# Altium schematic sheet bspd.SchDoc
size 594 x 420 mm
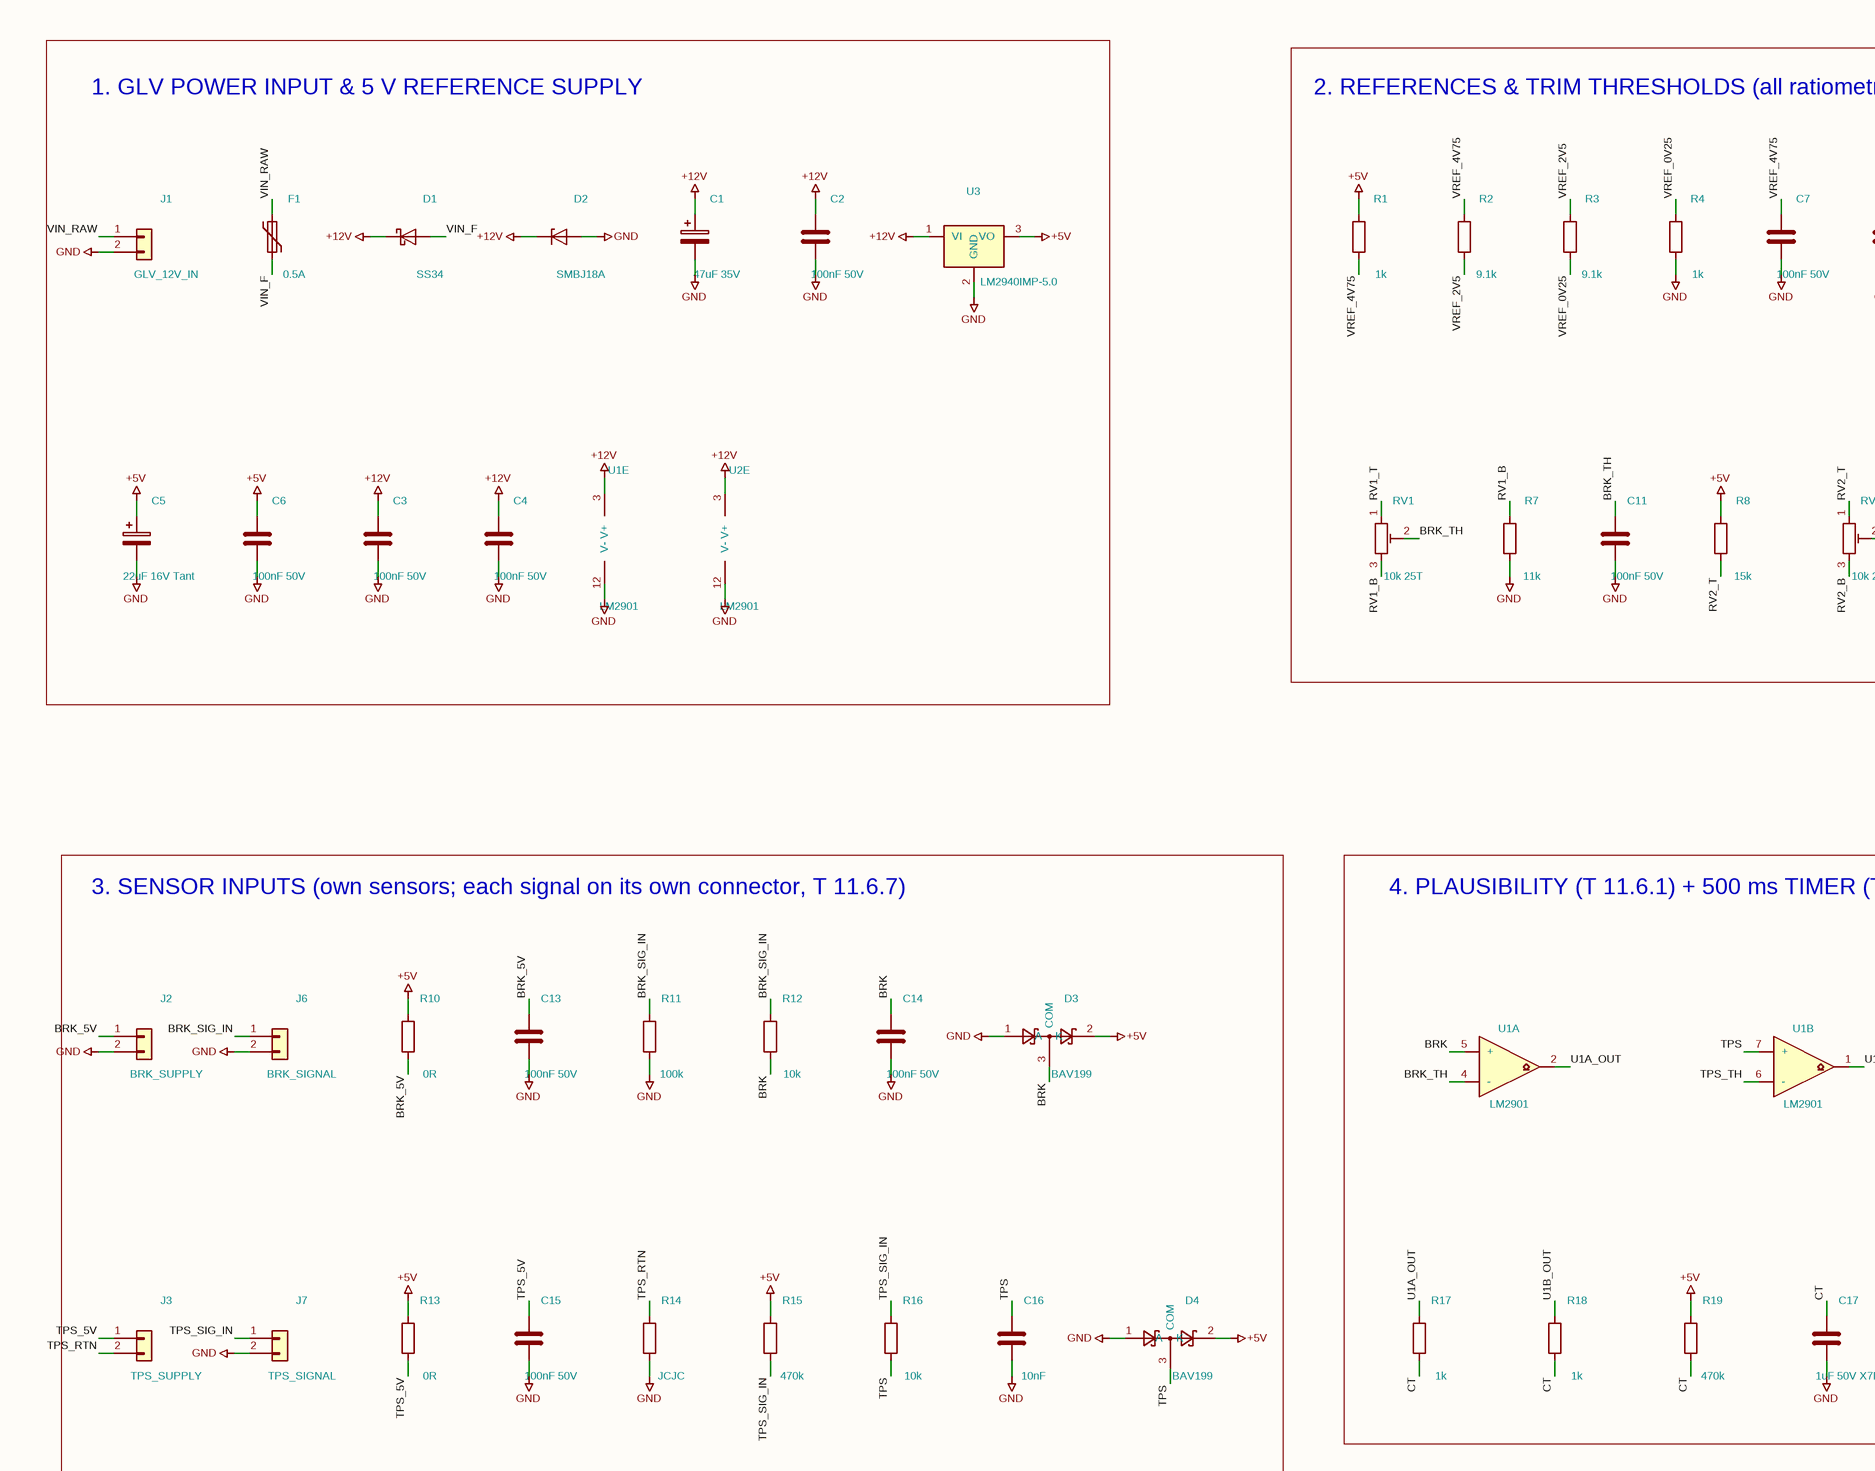
[diagram p0: bspd.SchDoc, top left]
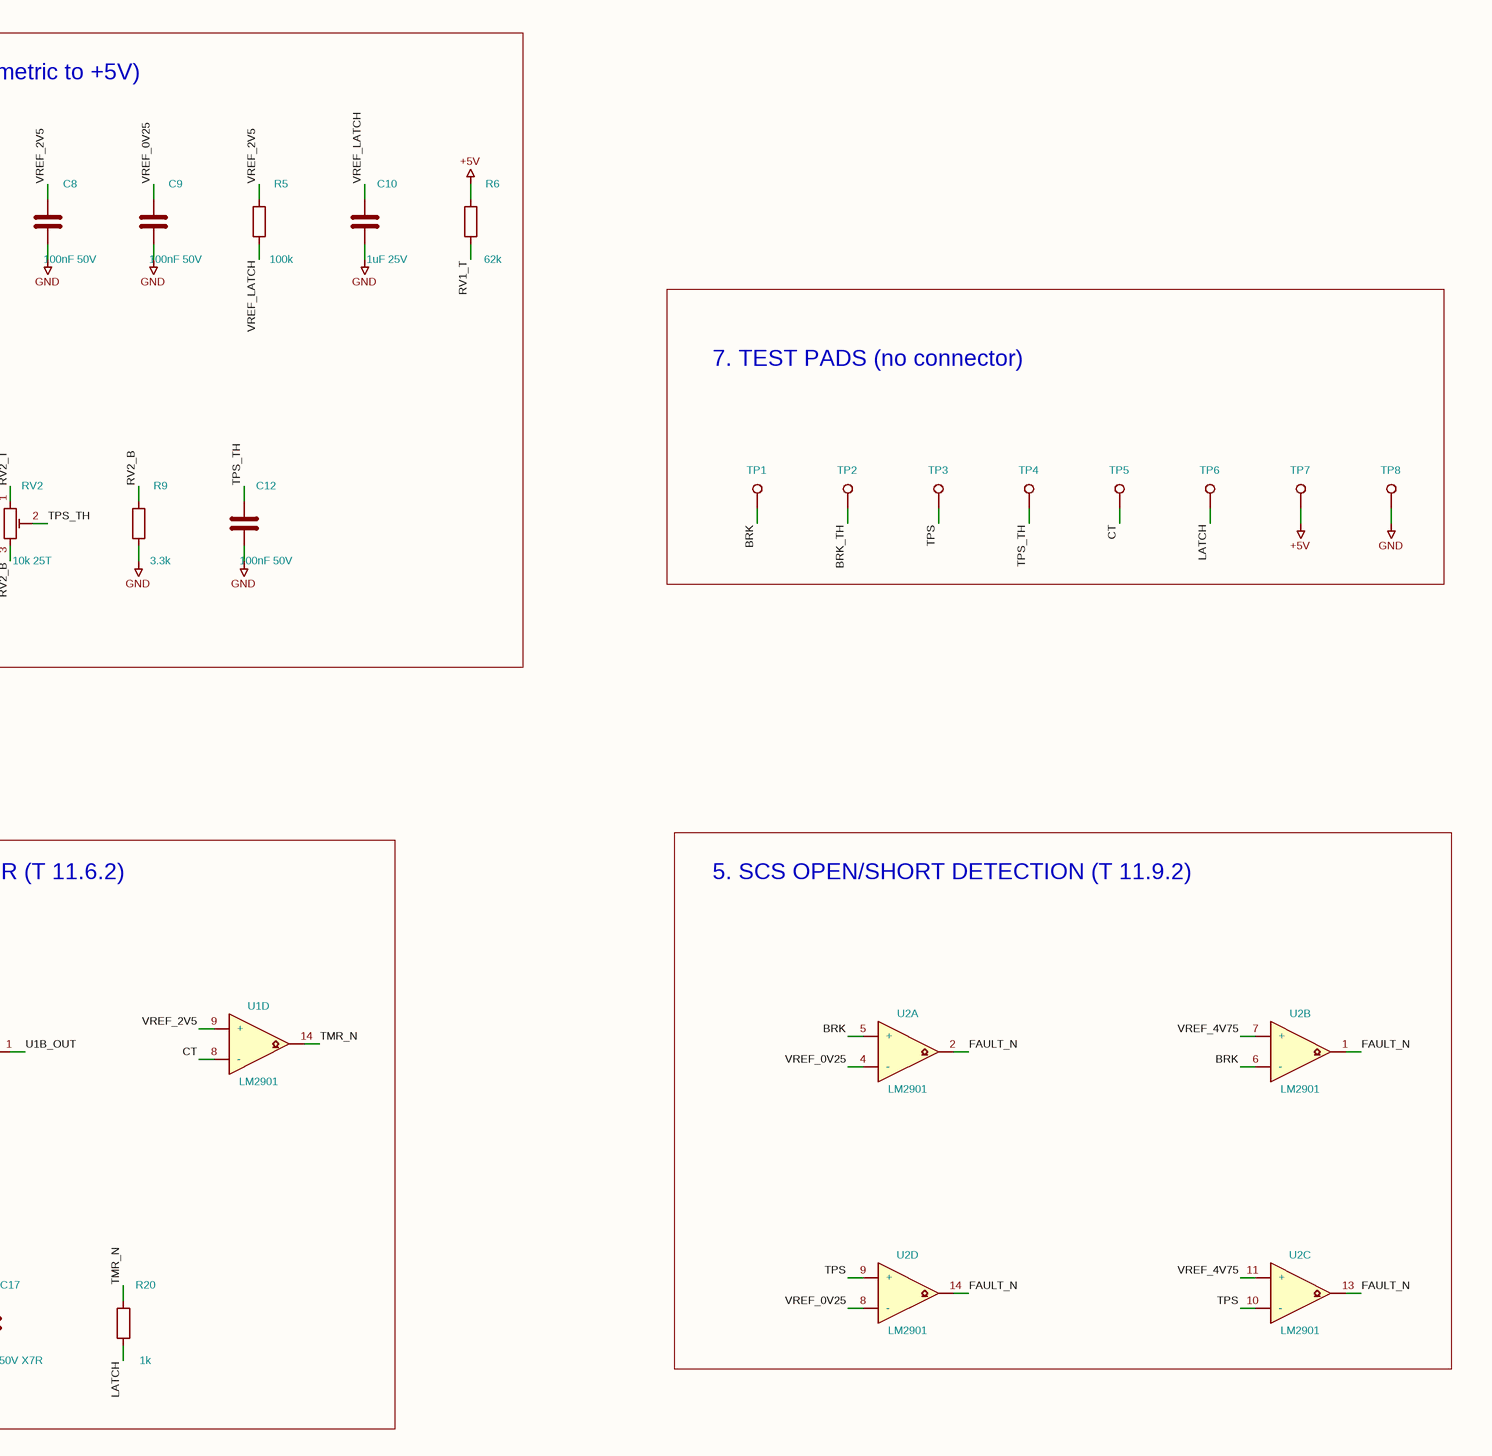
[diagram p1: bspd.SchDoc, top right]
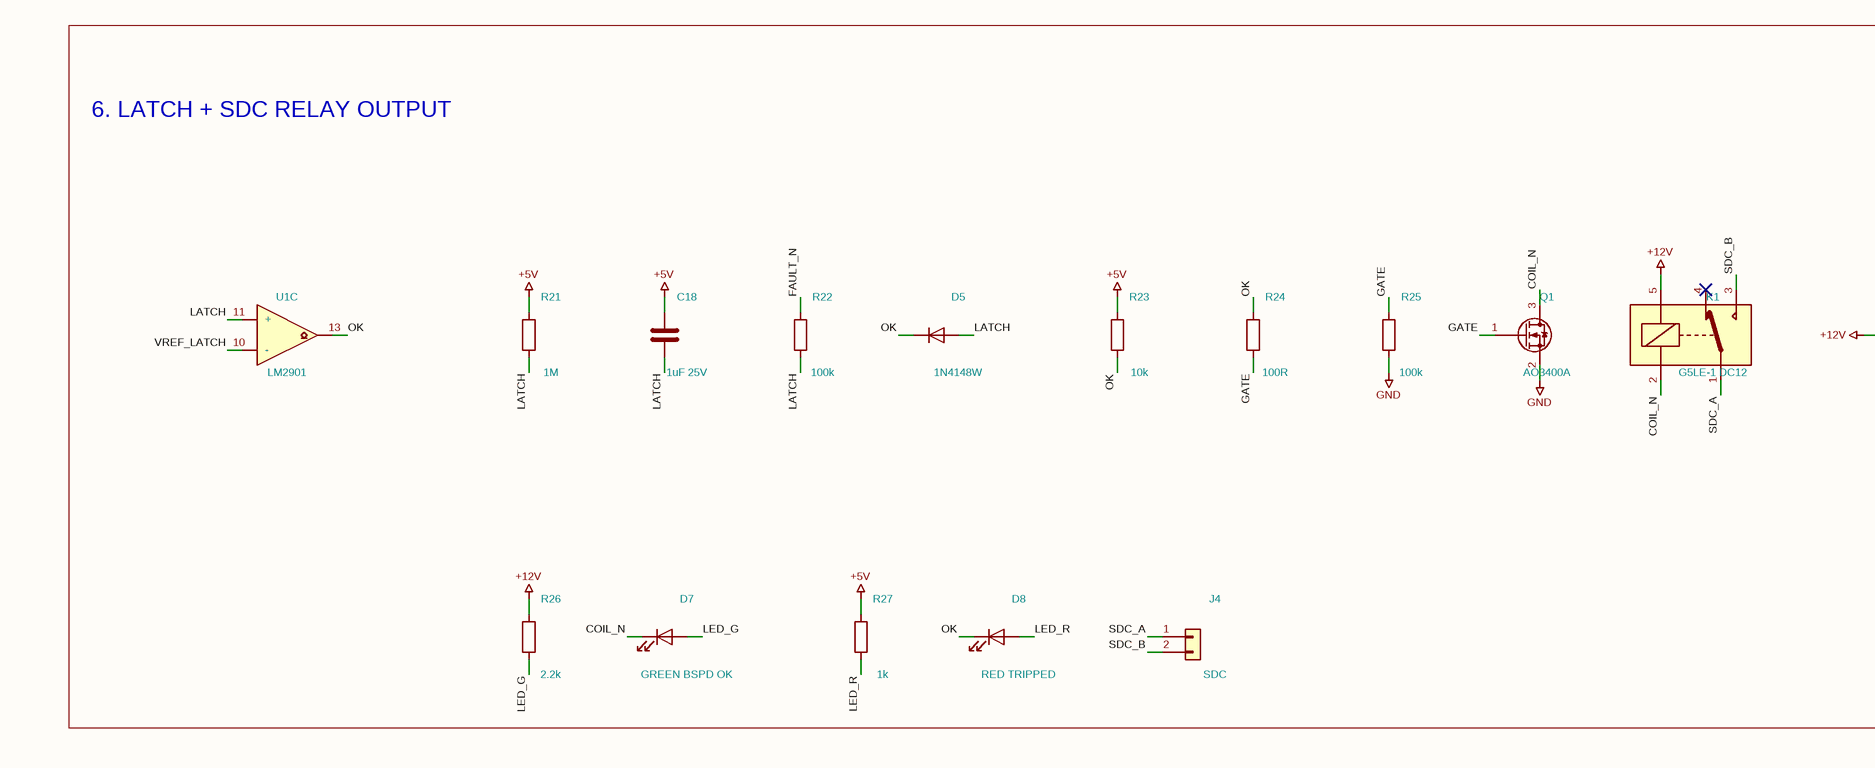
[diagram p2: bspd.SchDoc, bottom left]
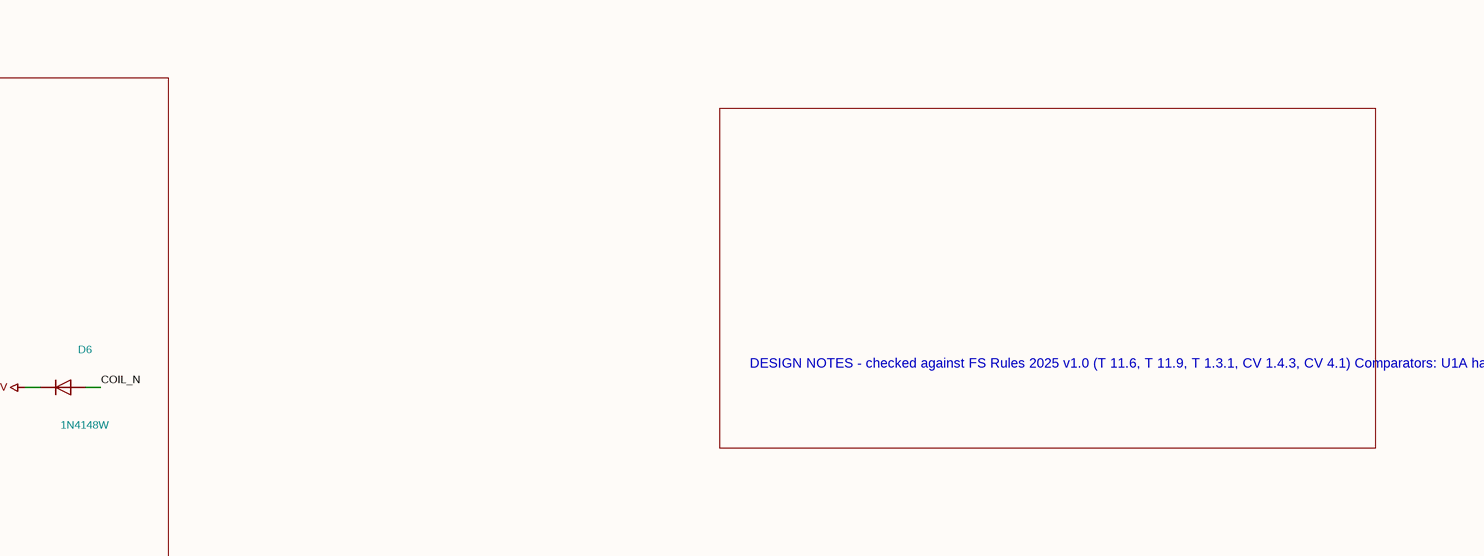
[diagram p3: bspd.SchDoc, bottom right]

## Parts
C1  47uF 35V  [CP_Elec_6.3x7.7]
C2  100nF 50V  [C_0603_1608Metric]
C3  100nF 50V  [C_0603_1608Metric]
C4  100nF 50V  [C_0603_1608Metric]
C5  22uF 16V Tant  [CP_EIA-3528-21_Kemet-B]
C6  100nF 50V  [C_0603_1608Metric]
C7  100nF 50V  [C_0603_1608Metric]
C8  100nF 50V  [C_0603_1608Metric]
C9  100nF 50V  [C_0603_1608Metric]
C10  1uF 25V  [C_0805_2012Metric]
C11  100nF 50V  [C_0603_1608Metric]
C12  100nF 50V  [C_0603_1608Metric]
C13  100nF 50V  [C_0603_1608Metric]
C14  100nF 50V  [C_0603_1608Metric]
C15  100nF 50V  [C_0603_1608Metric]
C16  10nF  [C_0603_1608Metric]
C17  1uF 50V X7R  [C_1206_3216Metric]
C18  1uF 25V  [C_0805_2012Metric]
D1  SS34  [D_SMA]
D2  SMBJ18A  [D_SMB]
D3  BAV199  [SOT-23]
D4  BAV199  [SOT-23]
D5  1N4148W  [D_SOD-123]
D6  1N4148W  [D_SOD-123]
D7  GREEN BSPD OK  [LED_0805_2012Metric]
D8  RED TRIPPED  [LED_0805_2012Metric]
F1  0.5A  [Fuse_1812_4532Metric]
J1  GLV_12V_IN  [Molex_Micro-Fit_3.0_43650-0215_1x02_P3.00mm_Vertical]
J2  BRK_SUPPLY  [Molex_Micro-Fit_3.0_43650-0215_1x02_P3.00mm_Vertical]
J3  TPS_SUPPLY  [Molex_Micro-Fit_3.0_43650-0215_1x02_P3.00mm_Vertical]
J4  SDC  [Molex_Micro-Fit_3.0_43650-0215_1x02_P3.00mm_Vertical]
J6  BRK_SIGNAL  [Molex_Micro-Fit_3.0_43650-0215_1x02_P3.00mm_Vertical]
J7  TPS_SIGNAL  [Molex_Micro-Fit_3.0_43650-0215_1x02_P3.00mm_Vertical]
K1  G5LE-1 DC12  [Relay_SPDT_Omron-G5LE-1]
Q1  AO3400A  [SOT-23]
R1  1k  [R_0603_1608Metric]
R2  9.1k  [R_0603_1608Metric]
R3  9.1k  [R_0603_1608Metric]
R4  1k  [R_0603_1608Metric]
R5  100k  [R_0603_1608Metric]
R6  62k  [R_0603_1608Metric]
R7  11k  [R_0603_1608Metric]
R8  15k  [R_0603_1608Metric]
R9  3.3k  [R_0603_1608Metric]
R10  0R  [R_2512_6332Metric]
R11  100k  [R_0603_1608Metric]
R12  10k  [R_0603_1608Metric]
R13  0R  [R_0603_1608Metric]
R14  value JCJC  [R_0603_1608Metric]  (hidden comment: 0R)
R15  470k  [R_0603_1608Metric]
R16  10k  [R_0603_1608Metric]
R17  1k  [R_0603_1608Metric]
R18  1k  [R_0603_1608Metric]
R19  470k  [R_0603_1608Metric]
R20  1k  [R_0603_1608Metric]
R21  1M  [R_0603_1608Metric]
R22  100k  [R_0603_1608Metric]
R23  10k  [R_0603_1608Metric]
R24  100R  [R_0603_1608Metric]
R25  100k  [R_0603_1608Metric]
R26  2.2k  [R_0603_1608Metric]
R27  1k  [R_0603_1608Metric]
RV1  10k 25T  [Potentiometer_Bourns_3296W_Vertical]
RV2  10k 25T  [Potentiometer_Bourns_3296W_Vertical]
TP1  BRK  [TestPoint_Pad_D1.5mm]  (value not drawn)
TP2  BRK_TH  [TestPoint_Pad_D1.5mm]  (value not drawn)
TP3  TPS  [TestPoint_Pad_D1.5mm]  (value not drawn)
TP4  TPS_TH  [TestPoint_Pad_D1.5mm]  (value not drawn)
TP5  CT  [TestPoint_Pad_D1.5mm]  (value not drawn)
TP6  LATCH  [TestPoint_Pad_D1.5mm]  (value not drawn)
TP7  +5V  [TestPoint_Pad_D1.5mm]  (value not drawn)
TP8  GND  [TestPoint_Pad_D1.5mm]  (value not drawn)
U1  LM2901  [SOIC-14_3.9x8.7mm_P1.27mm]  (parts A,B,C,D,E of 5)
U2  LM2901  [SOIC-14_3.9x8.7mm_P1.27mm]  (parts A,B,C,D,E of 5)
U3  LM2940IMP-5.0  [SOT-223-3_TabPin2]

## Blocks framed on the sheet
1. GLV POWER INPUT & 5 V REFERENCE SUPPLY: C1-C6 D1 D2 F1 J1 U1-U3
2. REFERENCES & TRIM THRESHOLDS (all ratiometric to +5V): C7-C12 R1-R9 RV1 RV2
7. TEST PADS (no connector): TP1-TP8
4. PLAUSIBILITY (T 11.6.1) + 500 ms TIMER (T 11.6.2): C17 R17-R20 U1
5. SCS OPEN/SHORT DETECTION (T 11.9.2): U2
6. LATCH + SDC RELAY OUTPUT: C18 D5-D8 J4 K1 Q1 R21-R27 U1

## Nets
+5V: C5.1 C6.1 C18.1 D3.2(K) D4.2(K) R1.1 R6.1 R8.1 R10.1 R13.1 R15.1 R19.1 R21.1 R23.1 R27.1 TP7.1 U3.3(VO)
+12V: C1.1 C2.1 C3.1 C4.1 D1.1(K) D2.1(K) D6.1(K) K1.5 R26.1 U1.3(V+) U2.3(V+) U3.1(VI)
GND: C1.2 C2.2 C3.2 C4.2 C5.2 C6.2 C7.2 C8.2 C9.2 C10.2 C11.2 C12.2 C13.2 C14.2 C15.2 C16.2 C17.2 D2.2(A) D3.1(A) D4.1(A) J1.2(Pin_2) J2.2(Pin_2) J6.2(Pin_2) J7.2(Pin_2) Q1.2(S) R4.2 R7.2 R9.2 R11.2 R14.2 R25.2 TP8.1 U1.12(V-) U2.12(V-) U3.2(GND)
BRK: C14.1 D3.3(COM) R12.2 TP1.1 U1.5(+) U2.5(+) U2.6(-)
BRK_5V: C13.1 J2.1(Pin_1) R10.2
BRK_SIG_IN: J6.1(Pin_1) R11.1 R12.1
BRK_TH: C11.1 RV1.2 TP2.1 U1.4(-)
COIL_N: D6.2(A) D7.1(K) K1.2 Q1.3(D)
CT: C17.1 R17.2 R18.2 R19.2 TP5.1 U1.8(-)
FAULT_N: R22.1 U2.1 U2.2 U2.13 U2.14
GATE: Q1.1(G) R24.2 R25.1
LATCH: C18.2 D5.2(A) R20.2 R21.2 R22.2 TP6.1 U1.11(+)
LED_G: D7.2(A) R26.2
LED_R: D8.2(A) R27.2
OK: D5.1(K) D8.1(K) R23.2 R24.1 U1.13
RV1_B: R7.1 RV1.3
RV1_T: R6.2 RV1.1
RV2_B: R9.1 RV2.3
RV2_T: R8.2 RV2.1
SDC_A: J4.1(Pin_1) K1.1
SDC_B: J4.2(Pin_2) K1.3
TMR_N: R20.1 U1.14
TPS: C16.1 D4.3(COM) R16.2 TP3.1 U1.7(+) U2.9(+) U2.10(-)
TPS_5V: C15.1 J3.1(Pin_1) R13.2
TPS_RTN: J3.2(Pin_2) R14.1
TPS_SIG_IN: J7.1(Pin_1) R15.2 R16.1
TPS_TH: C12.1 RV2.2 TP4.1 U1.6(-)
U1A_OUT: R17.1 U1.2
U1B_OUT: R18.1 U1.1
VIN_F: D1.2(A) F1.2
VIN_RAW: F1.1 J1.1(Pin_1)
VREF_0V25: C9.1 R3.2 R4.1 U2.4(-) U2.8(-)
VREF_2V5: C8.1 R2.2 R3.1 R5.1 U1.9(+)
VREF_4V75: C7.1 R1.2 R2.1 U2.7(+) U2.11(+)
VREF_LATCH: C10.1 R5.2 U1.10(-)

Not connected (* = marked no-connect by the designer): K1 4*

## Notes on the sheet
- 3. SENSOR INPUTS (own sensors; each signal on its own connector, T 11.6.7)
- DESIGN NOTES - checked against FS Rules 2025 v1.0 (T 11.6, T 11.9, T 1.3.1, CV 1.4.3, CV 4.1)
  Comparators: U1A hard brake | U1B throttle > 20 % | U1D 500 ms timer | U1C latch
  U2A/U2B brake signal window | U2D/U2C throttle signal window
  T 11.6.1  Trip when BRK > BRK_TH AND TPS > TPS_TH. Latched until LVMS power cycle.
  T 11.6.2  Delay 0.693 x R19 x C17 = 326 ms (Monte-Carlo 256-350 ms) < 500 ms.
  T 11.6.3  J1 wired DIRECTLY from LVMS output (only fuse/connectors in between).
  T 11.6.4  Only interfaces: J1 power, J2/J6 brake sensor, J3/J7 throttle sensor, J4 SDC.
  T 11.6.5  RV1 range 0.66-1.27 V = 5.6-26.4 bar (MLH02K 0.5-4.5 V = 0-138 bar): always <= 30 bar.
  Set below wheel-lock pressure. BRK_TH = 0.5 V + 0.029 V/bar x P.
  T 11.6.7  Each sensor signal on its own connector (J6, J7) - unplug to test.
  T 11.9.2  Open / short-GND / short-5V on any sensor wire -> trip in ~70 ms.
  CV 1.4.3  Throttle sensor on the THROTTLE BODY shaft. TPS_TH = V_idle + 0.20 x (V_WOT - V_closed).
  CV 4.1.1  K1 COM(1)/NO(3) in series with the SDC; SDC must feed >=2 mechanical relays
  (fuel pump relay + ignition/injection relay).  CV 4.1.3: de-energised K1 = SDC open.
  C5 must be tantalum (LDO stability). Lock RV1/RV2 with paint after setting.
- 1
- 2
- 3
- 4
- 5
- 6
- 7
- 8
- 9
- 10
- 11
- A
- B
- C
- D
- E
- F
- G
- H
- CV car, Kawasaki ER-6n 650 (stock ECU). Non-programmable, latching, fail-safe.
- Verified: ngspice behavioural sim + exported-netlist cross-check
- Checked against FS Rules 2025 v1.0: T 11.6, T 11.9, T 1.3.1, CV 1.4.3, CV 4.1
- Title: Brake System Plausibility Device (BSPD) - Option A
- File: bspd.kicad_sch
- Sheet: /
- ZFR Formula SAE - Electrical
- KiCad E.D.A.  kicad (5.1.4)-1
- Size: A2
- Date: 2026-11-02
- Rev: B
- Id: 1/1

## Library data of the parts
C1 = C_Polarized: MPN: Panasonic EEE-FK1V470P; Alt1: Nichicon UWT1V470MCL1GS; Note: Bulk, aluminium electrolytic; Value: 47uF 35V; Footprint: bspd:CP_Elec_6.3x7.7
C2 C6-C9 C11-C15 = C: MPN: Samsung CL10B104KB8NNNC; Alt1: Murata GRM188R71H104KA93D; Value: 100nF 50V; Footprint: bspd:C_0603_1608Metric
C3 = C: MPN: Samsung CL10B104KB8NNNC; Alt1: Murata GRM188R71H104KA93D; Note: U1 decoupling (place at pin 3); Value: 100nF 50V; Footprint: bspd:C_0603_1608Metric
C4 = C: MPN: Samsung CL10B104KB8NNNC; Alt1: Murata GRM188R71H104KA93D; Note: U2 decoupling (place at pin 3); Value: 100nF 50V; Footprint: bspd:C_0603_1608Metric
C5 = C_Polarized: MPN: KEMET T491B226K016AT; Alt1: AVX TAJB226K016RNJ; Note: LDO output cap: tantalum (ESR 0.1-1 ohm needed for LM2940 stability, NOT ceramic); Value: 22uF 16V Tant; Footprint: bspd:CP_EIA-3528-21_Kemet-B
C10 = C: MPN: Samsung CL21B105KAFNNNE; Alt1: Murata GRM21BR71E105KA99L; Value: 1uF 25V; Footprint: bspd:C_0805_2012Metric
C16 = C: MPN: Samsung CL10B103KB8NNNC; Alt1: Murata GRM188R71H103KA01D; Note: 10 nF (not 100 nF) so open-wiper fault trips < 100 ms; Value: 10nF; Footprint: bspd:C_0603_1608Metric
C17 = C: MPN: Murata GRM31MR71H105KA88L; Alt1: Samsung CL31B105KBHNNNE; Alt2: TDK C3216X7R1H105K160AB; Note: Timing cap (50 V X7R 1206 for low DC-bias loss); Value: 1uF 50V X7R; Footprint: bspd:C_1206_3216Metric
C18 = C: MPN: Samsung CL21B105KAFNNNE; Alt1: Murata GRM21BR71E105KA99L; Note: To +5V (not GND): latch powers up in OK state; Value: 1uF 25V; Footprint: bspd:C_0805_2012Metric
D1 = D_Schottky: MPN: SS34 (onsemi/MCC); Alt1: B340A-13-F; Alt2: SS36; Note: Reverse-polarity protection, 3 A 40 V; Value: SS34; Footprint: bspd:D_SMA
D2 = D_Zener: MPN: Littelfuse SMBJ18A; Alt1: Vishay SMBJ18A-E3/52; Alt2: Littelfuse P6SMB22A; Note: Unidirectional TVS 18 V stand-off (load-dump clamp); Value: SMBJ18A; Footprint: bspd:D_SMB
D3 D4 = BAT54S: MPN: Nexperia BAT54S,215; Alt1: onsemi BAT54SLT1G; Alt2: Diodes BAT54S-7-F; Note: Input clamp; Value: BAV199; Footprint: bspd:SOT-23
D5 = D: MPN: Diodes Inc 1N4148W-7-F; Alt1: onsemi MMSD4148T1G; Alt2: Nexperia 1N4148W,115; Note: Latch hold diode; Value: 1N4148W; Footprint: bspd:D_SOD-123
D6 = D: MPN: Diodes Inc 1N4148W-7-F; Alt1: onsemi MMSD4148T1G; Alt2: Nexperia 1N4148W,115; Note: Coil flyback; Value: 1N4148W; Footprint: bspd:D_SOD-123
D7 = LED: MPN: Kingbright APT2012SGC; Alt1: Lite-On LTST-C171GKT; Note: On = relay closed; Value: GREEN BSPD OK; Footprint: bspd:LED_0805_2012Metric
D8 = LED: MPN: Kingbright APT2012SURCK; Alt1: Lite-On LTST-C171KRKT; Note: On = latched trip; Value: RED TRIPPED; Footprint: bspd:LED_0805_2012Metric
F1 = Polyfuse: MPN: Bourns MF-MSMF050-2; Alt1: Littelfuse 1812L050PR; Note: Resettable fuse 0.5 A hold; Value: 0.5A; Footprint: bspd:Fuse_1812_4532Metric
J1 = Conn_01x02: MPN: Molex 43650-0215; Alt1: Molex 43650-0221; Alt2: Any Micro-Fit 3.0 compatible vertical 2-pin; Note: GLV 12 V in (after GLVMS, NOT via SDC); Value: GLV_12V_IN; Footprint: bspd:Molex_Micro-Fit_3.0_43650-0215_1x02_P3.00mm_Vertical
J2 = Conn_01x02: MPN: Molex 43650-0215; Alt1: Molex 43650-0221; Note: MLH02KPSB06A supply: 1=+5V 2=GND; Value: BRK_SUPPLY; Footprint: bspd:Molex_Micro-Fit_3.0_43650-0215_1x02_P3.00mm_Vertical
J3 = Conn_01x02: MPN: Molex 43650-0215; Alt1: Molex 43650-0221; Note: Throttle-body sensor 3382H-1-103 track: 1=CW end 2=CCW end; Value: TPS_SUPPLY; Footprint: bspd:Molex_Micro-Fit_3.0_43650-0215_1x02_P3.00mm_Vertical
J4 = Conn_01x02: MPN: Molex 43650-0215; Alt1: Molex 43650-0221; Note: In series with shutdown circuit; Value: SDC; Footprint: bspd:Molex_Micro-Fit_3.0_43650-0215_1x02_P3.00mm_Vertical
J6 = Conn_01x02: MPN: Molex 43650-0215; Alt1: Molex 43650-0221; Note: MLH02KPSB06A output (separately disconnectable, T 11.6.7): 1=signal 2=shield; Value: BRK_SIGNAL; Footprint: bspd:Molex_Micro-Fit_3.0_43650-0215_1x02_P3.00mm_Vertical
J7 = Conn_01x02: MPN: Molex 43650-0215; Alt1: Molex 43650-0221; Note: 3382H wiper (separately disconnectable, T 11.6.7): 1=wiper 2=shield; Value: TPS_SIGNAL; Footprint: bspd:Molex_Micro-Fit_3.0_43650-0215_1x02_P3.00mm_Vertical
K1 = G5LE-1: MPN: Omron G5LE-1 DC12; Alt1: Omron G5LE-14 DC12 (sealed); Alt2: Omron G5LE-1-E DC12; Note: SDC relay; uses COM(1)+NO(3) - closed only when healthy; Value: G5LE-1 DC12; Footprint: bspd:Relay_SPDT_Omron-G5LE-1
Q1 = Q_NMOS_GSD: MPN: AOS AO3400A; Alt1: Vishay Si2302CDS; Alt2: Infineon IRLML6344; Note: Relay driver; Value: AO3400A; Footprint: bspd:SOT-23
R1 = R: MPN: Yageo RC0603FR-071KL; Alt1: UNI-ROYAL 0603WAF1001T5E; Alt2: Panasonic ERJ-3EKF1001V; Note: Ref ladder (1 %); Value: 1k; Footprint: bspd:R_0603_1608Metric
R2 R3 = R: MPN: Yageo RC0603FR-079K1L; Alt1: UNI-ROYAL 0603WAF9101T5E; Alt2: Panasonic ERJ-3EKF9101V; Value: 9.1k; Footprint: bspd:R_0603_1608Metric
R4 R20 R27 = R: MPN: Yageo RC0603FR-071KL; Alt1: UNI-ROYAL 0603WAF1001T5E; Alt2: Panasonic ERJ-3EKF1001V; Value: 1k; Footprint: bspd:R_0603_1608Metric
R5 = R: MPN: Yageo RC0603FR-07100KL; Alt1: UNI-ROYAL 0603WAF1003T5E; Alt2: Panasonic ERJ-3EKF1003V; Note: Latch-reference lag (power-up immunity); Value: 100k; Footprint: bspd:R_0603_1608Metric
R6 = R: MPN: Yageo RC0603FR-0762KL; Alt1: UNI-ROYAL 0603WAF6202T5E; Alt2: Panasonic ERJ-3EKF6202V; Note: Limits RV1 max to 1.27 V = 26.4 bar nom., 28.4 bar worst case (T 11.6.5 <=30 bar); Value: 62k; Footprint: bspd:R_0603_1608Metric
R7 = R: MPN: Yageo RC0603FR-0711KL; Alt1: UNI-ROYAL 0603WAF1102T5E; Alt2: Panasonic ERJ-3EKF1102V; Value: 11k; Footprint: bspd:R_0603_1608Metric
R8 = R: MPN: Yageo RC0603FR-0715KL; Alt1: UNI-ROYAL 0603WAF1502T5E; Alt2: Panasonic ERJ-3EKF1502V; Value: 15k; Footprint: bspd:R_0603_1608Metric
R9 = R: MPN: Yageo RC0603FR-073K3L; Alt1: UNI-ROYAL 0603WAF3301T5E; Alt2: Panasonic ERJ-3EKF3301V; Value: 3.3k; Footprint: bspd:R_0603_1608Metric
R10 = R: MPN: Yageo RC2512FK-0747RL; Alt1: Vishay CRCW251247R0FKEG; Note: Sensor-supply short protection; Value: 0R; Footprint: bspd:R_2512_6332Metric
R11 = R: MPN: Yageo RC0603FR-07100KL; Alt1: UNI-ROYAL 0603WAF1003T5E; Alt2: Panasonic ERJ-3EKF1003V; Note: Pull-down: open wire -> 0 V -> fault; Value: 100k; Footprint: bspd:R_0603_1608Metric
R12 R16 R23 = R: MPN: Yageo RC0603FR-0710KL; Alt1: UNI-ROYAL 0603WAF1002T5E; Alt2: Panasonic ERJ-3EKF1002V; Value: 10k; Footprint: bspd:R_0603_1608Metric
R13 = R: MPN: Yageo RC0603FR-071KL; Alt1: UNI-ROYAL 0603WAF1001T5E; Alt2: Panasonic ERJ-3EKF1001V; Note: Pot top series (current limit + rail margin); Value: 0R; Footprint: bspd:R_0603_1608Metric
R14 = R: MPN: Yageo RC0603FR-071KL; Alt1: UNI-ROYAL 0603WAF1001T5E; Alt2: Panasonic ERJ-3EKF1001V; Note: Pot bottom series; Footprint: bspd:R_0603_1608Metric
R15 = R: MPN: Yageo RC0603FR-07470KL; Alt1: UNI-ROYAL 0603WAF4703T5E; Alt2: Panasonic ERJ-3EKF4703V; Note: Pull-UP: open wiper/GND -> 5 V -> fault; Value: 470k; Footprint: bspd:R_0603_1608Metric
R17 R18 = R: MPN: Yageo RC0603FR-071KL; Alt1: UNI-ROYAL 0603WAF1001T5E; Alt2: Panasonic ERJ-3EKF1001V; Note: CT discharge; Value: 1k; Footprint: bspd:R_0603_1608Metric
R19 = R: MPN: Yageo RC0603FR-07470KL; Alt1: UNI-ROYAL 0603WAF4703T5E; Alt2: Panasonic ERJ-3EKF4703V; Note: Timer: 0.693*R19*C17 = 326 ms; Value: 470k; Footprint: bspd:R_0603_1608Metric
R21 = R: MPN: Yageo RC0603FR-071ML; Alt1: UNI-ROYAL 0603WAF1004T5E; Alt2: Panasonic ERJ-3EKF1004V; Value: 1M; Footprint: bspd:R_0603_1608Metric
R22 = R: MPN: Yageo RC0603FR-07100KL; Alt1: UNI-ROYAL 0603WAF1003T5E; Alt2: Panasonic ERJ-3EKF1003V; Note: Fault filter ~70 ms; Value: 100k; Footprint: bspd:R_0603_1608Metric
R24 = R: MPN: Yageo RC0603FR-07100RL; Alt1: UNI-ROYAL 0603WAF1000T5E; Alt2: Panasonic ERJ-3EKF1000V; Value: 100R; Footprint: bspd:R_0603_1608Metric
R25 = R: MPN: Yageo RC0603FR-07100KL; Alt1: UNI-ROYAL 0603WAF1003T5E; Alt2: Panasonic ERJ-3EKF1003V; Value: 100k; Footprint: bspd:R_0603_1608Metric
R26 = R: MPN: Yageo RC0603FR-072K2L; Alt1: UNI-ROYAL 0603WAF2201T5E; Alt2: Panasonic ERJ-3EKF2201V; Value: 2.2k; Footprint: bspd:R_0603_1608Metric
RV1 = R_Potentiometer_Trim: MPN: Bourns 3296W-1-103LF; Alt1: Vishay T93YA103KT20; Alt2: Suntan TSR-3296W-103; Note: Hard-brake threshold trim 0.66-1.27 V = 5.6-26.4 bar; Value: 10k 25T; Footprint: bspd:Potentiometer_Bourns_3296W_Vertical
RV2 = R_Potentiometer_Trim: MPN: Bourns 3296W-1-103LF; Alt1: Vishay T93YA103KT20; Alt2: Suntan TSR-3296W-103; Note: Throttle-body 20 % threshold trim 0.58-2.35 V; Value: 10k 25T; Footprint: bspd:Potentiometer_Bourns_3296W_Vertical
TP1-TP8 = TestPoint: MPN: PCB pad only (no part); Note: Test pad (no header: T 11.6.4 minimal interfaces); Footprint: bspd:TestPoint_Pad_D1.5mm
  TP1: Value: BRK
  TP2: Value: BRK_TH
  TP3: Value: TPS
  TP4: Value: TPS_TH
  TP5: Value: CT
  TP6: Value: LATCH
  TP7: Value: +5V
  TP8: Value: GND
U1 = LM2901: Note: Hard brake detect; Value: LM2901; Footprint: bspd:SOIC-14_3.9x8.7mm_P1.27mm
U2 = LM2901: Note: Brake < 0.25 V; Value: LM2901; Footprint: bspd:SOIC-14_3.9x8.7mm_P1.27mm
U3 = SPX2920M3-5.0_SOT223: MPN: TI LM2940IMP-5.0/NOPB; Alt1: TI LM2937IMP-5.0/NOPB; Note: 5 V automotive LDO (reverse-battery & load-dump rated); Value: LM2940IMP-5.0; Footprint: bspd:SOT-223-3_TabPin2